# Altium project 60ghz radar main v1.1.PrjPcb (part 2 of 2)

## Sheet radar sch.SchDoc
size A4; SheetNumber: 3; SheetTotal: 4
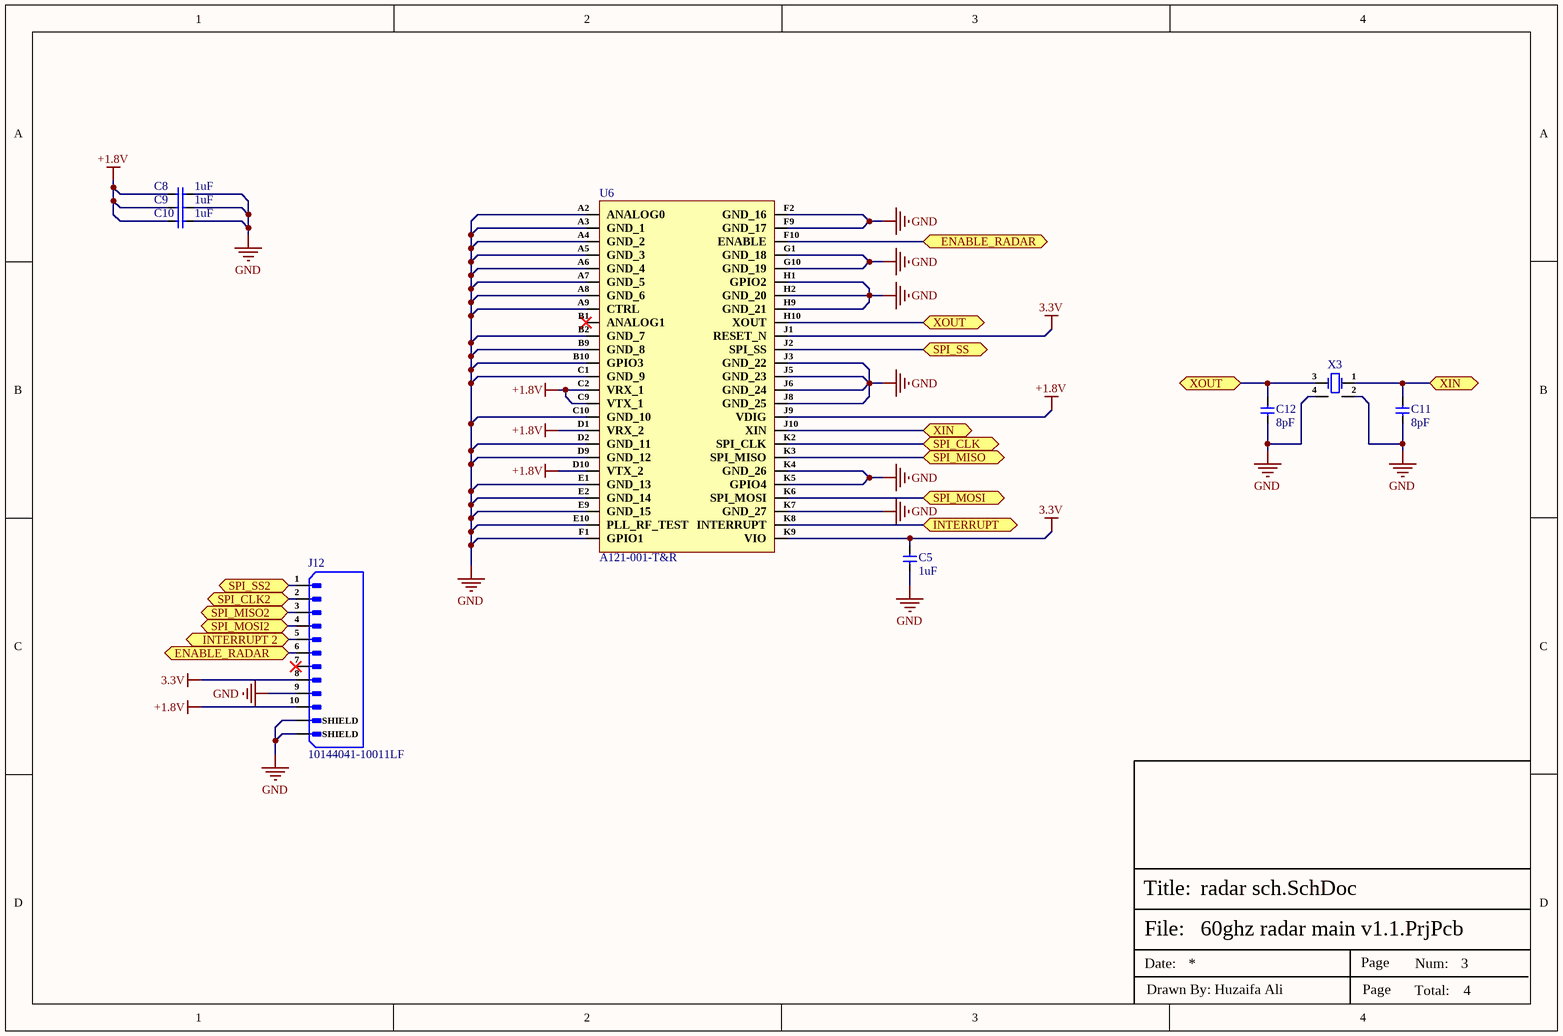
[diagram p2: radar sch.SchDoc]

### Parts
C5  1uF  [Cap-0402]
C8  1uF  [Cap-0402]
C9  1uF  [Cap-0402]
C10  1uF  [Cap-0402]
C11  8pF  [Cap-0402]
C12  8pF  [Cap-0402]
J12  10144041-10011LF  [10144041-10011LF]
U6  A121-001-T&R  [50-FCCSP (5.2x5.5)]
X3  ECS-240-8-36-RWN-TR3  [SMD2520-4P]  (value not drawn)

### Ports
ENABLE_RADAR (bidir), INTERRUPT 2 (bidir), INTERRUPT (bidir), SPI_CLK2 (bidir), SPI_CLK (bidir), SPI_MISO2 (bidir), SPI_MISO (bidir), SPI_MOSI2 (bidir), SPI_MOSI (bidir), SPI_SS2 (bidir), SPI_SS (bidir), XIN (bidir), XOUT (bidir)

### Nets
3.3V: C5.2 J12.8 U6.J1(RESET_N) U6.K9(VIO)
+1.8V: C8.1 C9.1 C10.1 J12.10 U6.C2(VRX_1) U6.C9(VTX_1) U6.D1(VRX_2) U6.D10(VTX_2) U6.J9(VDIG)
GND: C5.1 C8.2 C9.2 C10.2 C11.1 C12.1 J12.9 J12.S1(SHIELD) U6.A2(ANALOG0) U6.A3(GND_1) U6.A4(GND_2) U6.A5(GND_3) U6.A6(GND_4) U6.A7(GND_5) U6.A8(GND_6) U6.A9(CTRL) U6.B2(GND_7) U6.B9(GND_8) U6.B10(GPIO3) U6.C1(GND_9) U6.C10(GND_10) U6.D2(GND_11) U6.D9(GND_12) U6.E1(GND_13) U6.E2(GND_14) U6.E9(GND_15) U6.E10(PLL_RF_TEST) U6.F1(GPIO1) U6.F2(GND_16) U6.F9(GND_17) U6.G1(GND_18) U6.G10(GND_19) U6.H1(GPIO2) U6.H2(GND_20) U6.H9(GND_21) U6.J3(GND_22) U6.J5(GND_23) U6.J6(GND_24) U6.J8(GND_25) U6.K4(GND_26) U6.K5(GPIO4) U6.K7(GND_27) X3.2(GND) X3.4(GND)
ENABLE_RADAR: J12.6 U6.F10(ENABLE) ; port ENABLE_RADAR
INTERRUPT: U6.K8(INTERRUPT) ; port INTERRUPT
INTERRUPT 2: J12.5 ; port INTERRUPT 2
SPI_CLK: U6.K2(SPI_CLK) ; port SPI_CLK
SPI_CLK2: J12.2 ; port SPI_CLK2
SPI_MISO: U6.K3(SPI_MISO) ; port SPI_MISO
SPI_MISO2: J12.3 ; port SPI_MISO2
SPI_MOSI: U6.K6(SPI_MOSI) ; port SPI_MOSI
SPI_MOSI2: J12.4 ; port SPI_MOSI2
SPI_SS: U6.J2(SPI_SS) ; port SPI_SS
SPI_SS2: J12.1 ; port SPI_SS2
XIN: C11.2 U6.J10(XIN) X3.1(IN/OUT) ; port XIN
XOUT: C12.2 U6.H10(XOUT) X3.3(Out/In) ; port XOUT

Not connected (* = marked no-connect by the designer): J12 7*; U6 B1(ANALOG1)*

### Notes on the sheet
- File:
- Title:
- Date:
- Page
- Num:
- Total:
- Drawn By: Huzaifa Ali

### Library data of the parts
C5 C8-C10 = CC0402KRX5R6BB105: CAP CER 1UF 10V X5R 0402; Manufacturer: Yageo; Tolerance: 10%; Dissipation Factor: 15%; Item Type: Capacitor; Supplier 1: Mouser; Manufacturer Part Number: CC0402KRX5R6BB105; RoHS: Yes; Category: Ceramic Capacitors; Stock 1: 6711367; Pricing 1: 1=0.11000, 10=0.05500, 50=0.05500, 100=0.03300, 500=0.02700, 1000=0.02200, 2500=0.02100, 10000=0.01800 (USD); Mount: Surface Mount; Case/Package: 0402; Number of Pins: 2; Case Code (Metric): 1005; Case Code (Imperial): 0402; Min Operating Temperature: -55°C; Max Operating Temperature: 85°C; Capacitance: 1uF; Dielectric: X5R; Package Quantity: 1; Voltage Rating: 10V; Packaging: Tape and Reel; Voltage Rating (DC): 10V; Termination: SMD/SMT; Resistor Type: Ceramic; Series: CC; Construction: Flat; Length: 1mm; Width: 0.02inch; Height: 0.5mm; Thickness: 0.022inch; Depth: 0.5mm; Radiation Hardening: No; REACH SVHC: No SVHC; Lead Free: Lead Free; Halogen Free: Halogen Free; RoHS Compliant: Yes; ComponentLink1URL: https://datasheet.ciiva.com/176/upy-gphc-x5r-4v-to-50v-12-176704.pdf?src-supplier=Digi-Key; ComponentLink1Description: https://datasheet.ciiva.com/176/upy-gphc-x5r-4v-to-50v-12-176704.pdf?src-supplier=Digi-Key; ComponentLink2URL: https://datasheet.ciiva.com/176/mlccorderingcode-176705.pdf?src-supplier=Digi-Key; ComponentLink2Description: https://datasheet.ciiva.com/176/mlccorderingcode-176705.pdf?src-supplier=Digi-Key; ComponentLink3URL: https://datasheet.ciiva.com/176/mlccorderingcode-176706.pdf?src-supplier=Digi-Key; ComponentLink3Description: https://datasheet.ciiva.com/176/mlccorderingcode-176706.pdf?src-supplier=Digi-Key; Supplier Part Number 1: 603-CC402KRX5R6BB105; LCSC Part Number: C106254
C11 C12 = 0402CG8R0C500NT: 50V 8pF C0G 0402 Multilayer Ceramic Capacitors MLCC - SMD/SMT ROHS; Manufacturer: FH (Guangdong Fenghua Advanced Tech); Manufacturer Part Number: 0402CG8R0C500NT; Package: 0402; LCSC Part Number: C1578; Item Type: Capacitor; ComponentLink1Description: LCSC; ComponentLink1URL: https://www.lcsc.com/product-detail/Multilayer-Ceramic-Capacitors-MLCC-SMD-SMT_FH-Guangdong-Fenghua-Advanced-Tech-0402CG8R0C500NT_C1578.html
J12 = 10144041-10011LF: CONN HEADER SMD R/A 10POS 0.8MM; Manufacturer: Amphenol ICC (FCI); Item Type: Right Angle Connector; Package: Custom; Manufacturer Part Number: 10144041-10011LF
U6 = A121-001-T&R: RADAR SENSOR SYSTEM-IN-PACKAGE B; Manufacturer: Acconeer; Item Type: IC; Supplier: Mouser; Supplier Part Number: 925-A121-001-T&R; Manufacturer Part Number: A121-001-T&R; RoHS: No; Category: LDO; Stock: 7442; Pricing: 1=13.72, 10=11.57, 50=10.22, 100=8.78, 1000=7.74, 10000=6.41 (USD)
X3 = ECS-240-8-36-RWN-TR3: CRYSTAL 24.0000MHZ 8PF SMD; Manufacturer: ECS Inc.; Package: None; Manufacturer Part Number: ECS-240-8-36-RWN-TR3; Item Type: Crystal

## Sheet battery check and motor.SchDoc
size A4; SheetNumber: 4; SheetTotal: 4
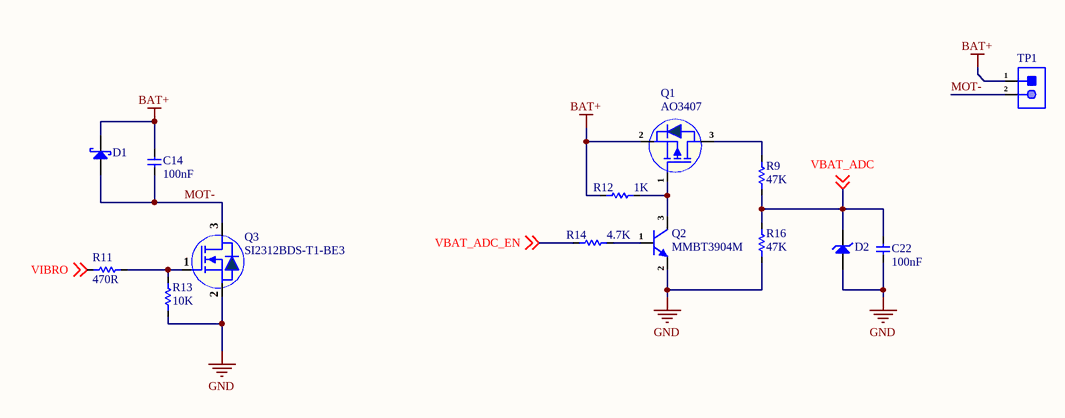
[diagram p3: battery check and motor.SchDoc]

### Parts
C14  100nF  [Cap-0402]
C22  100nF  [Cap-0402]
D1  BAT5402VH6327XTSA1  [SOD-523]  (value not drawn)
D2  MM3Z3V3B  [SOD323F]  (value not drawn)
Q1  AO3407  [SOT-23]
Q2  MMBT3904M  [SOT-723]
Q3  SI2312BDS-T1-BE3  [SOT-23]
R9  47K  [Res-0402]
R11  470R  [Res-0402]
R12  1K  [Res-0402]
R13  10K  [Res-0402]
R14  4.7K  [Res-0402]
R16  47K  [Res-0402]
TP1  2 Test Pad  [2 Test Pad]  (value not drawn)  (no BOM)

### Nets
BAT+: C14.2 D1.2(K) Q1.2(S) R12.1 TP1.1
GND: C22.2 D2.1(A) Q2.2(E) Q3.2(S) R13.1 R16.1
MOT-: C14.1 D1.1(A) Q3.3(D) TP1.2
VBAT_ADC: C22.1 D2.2(K) R9.1 R16.2 ; off-sheet VBAT_ADC
VBAT_ADC_EN: R14.1 ; off-sheet VBAT_ADC_EN
VIBRO: R11.1 ; off-sheet VIBRO
NetQ1_1: Q1.1(G) Q2.3(C) R12.2
NetQ1_3: Q1.3(D) R9.2
NetQ2_1: Q2.1(B) R14.2
NetQ3_1: Q3.1(G) R11.2 R13.2

### Notes on the sheet
- File:
- Title:
- Date:
- Page
- Num:
- Total:
- Drawn By: Huzaifa Ali

### Library data of the parts
C14 C22 = CC0402KRX5R7BB104: CAP CER 0.1UF 16V X5R 0402; Manufacturer: Yageo; Tolerance: 10%; Supplier 1: Mouser; Manufacturer Part Number: CC0402KRX5R7BB104; RoHS: Yes; Category: Ceramic Capacitors; Stock 1: 936792; Pricing 1: 1=0.10000, 10=0.02300, 50=0.02300, 100=0.01100, 1000=0.00600, 10000=0.00400 (USD); Mount: Surface Mount; Case/Package: 0402; Number of Pins: 2; Case Code (Metric): 1005; Case Code (Imperial): 0402; Min Operating Temperature: -55°C; Max Operating Temperature: 85°C; Capacitance: 100nF; Dielectric: X5R; Packaging: Tape and Reel; Voltage Rating: 16V; Package Quantity: 1; Voltage Rating (DC): 16V; Termination: SMD/SMT; Resistor Type: Ceramic; Series: CC; Construction: Flat; Length: 1mm; Width: 0.02inch; Height: 0.5mm; Thickness: 0.022inch; Depth: 0.5mm; Radiation Hardening: No; REACH SVHC: Unknown; Lead Free: Lead Free; Halogen Free: Halogen Free; RoHS Compliant: Yes; ComponentLink1URL: https://datasheet.ciiva.com/155/mlccorderingcode-155879.pdf?src-supplier=Digi-Key; ComponentLink1Description: https://datasheet.ciiva.com/155/mlccorderingcode-155879.pdf?src-supplier=Digi-Key; ComponentLink2URL: https://datasheet.ciiva.com/155/mlccorderingcode-155878.pdf?src-supplier=Digi-Key; ComponentLink2Description: https://datasheet.ciiva.com/155/mlccorderingcode-155878.pdf?src-supplier=Digi-Key; ComponentLink3URL: https://datasheet.ciiva.com/155/mlccorderingcode-155880.pdf?src-supplier=Digi-Key; ComponentLink3Description: https://datasheet.ciiva.com/155/mlccorderingcode-155880.pdf?src-supplier=Digi-Key; ComponentLink4URL: https://datasheet.ciiva.com/11464/upy-gphc-x5r-4v-to-50v-12-11464869.pdf?src-supplier=Avnet; ComponentLink4Description: https://datasheet.ciiva.com/11464/upy-gphc-x5r-4v-to-50v-12-11464869.pdf?src-supplier=Avnet; Supplier Part Number 1: 603-CC402KRX5R7BB104; LCSC Part Number: C106204
D1 = BAT5402VH6327XTSA1: DIODE SCHOTTKY 30V 200MA SC79-2; Manufacturer: Infineon; Value: 10pF; Item Type: Diode; Supplier: Mouser; Supplier Part Number: 726-BAT5402VH6327XTS; Manufacturer Part Number: BAT5402VH6327XTSA1; RoHS: Yes; Category: Rectifier Diodes; Stock: 316819; Pricing: 1=0.39, 10=0.245, 50=0.245, 100=0.122, 1000=0.103, 10000=0.071 (USD); Package Quantity: 3000NUMBER; Reverse Voltage: 30V
D2 = MM3Z3V3B: DIODE ZENER 3.3V 200MW SOD323F; Manufacturer: ON Semiconductor / Fairchild; Forward Voltage: 1V; Tolerance: 2%; Impedance: 89R; Max Reverse Leakage Current: 4.5uA; Test Current: 5mA; Element Configuration: Single; Supplier 1: Digi-Key; Manufacturer Part Number: MM3Z3V3B; Stock 1: 473644; Pricing 1: 1=0.22, 10=0.18, 100=0.0956, 500=0.06288, 1000=0.04276 (USD); Mount: Surface Mount; Number of Pins: 2; Weight: 0.0276g; Min Operating Temperature: -65°C; Max Operating Temperature: 150°C; Packaging: Tape and Reel; Package Quantity: 1; Max Power Dissipation: 200mW; Zener Voltage: 3.3V; Voltage Tolerance: 2%; Power Dissipation: 200mW; Working Voltage: 3.3V; Peak Reverse Current: 4.5uA; Length: 1.3mm; Height: 1mm; Width: 1.7mm; Radiation Hardening: No; REACH SVHC: No SVHC; Lead Free: Lead Free; ComponentLink1URL: http://www.onsemi.com/pub/Collateral/MM3Z9V1B-D.pdf?src-supplier=Digi-Key; ComponentLink1Description: http://www.onsemi.com/pub/Collateral/MM3Z9V1B-D.pdf?src-supplier=Digi-Key; ComponentLink2URL: http://www.mouser.com/ds/2/149/MM3Z3V3B-187166.pdf?src-supplier=Mouser; ComponentLink2Description: http://www.mouser.com/ds/2/149/MM3Z3V3B-187166.pdf?src-supplier=Mouser; ComponentLink3URL: https://www.fairchildsemi.com/datasheets/MM/MM3Z9V1B.pdf?src-supplier=Avnet; ComponentLink3Description: https://www.fairchildsemi.com/datasheets/MM/MM3Z9V1B.pdf?src-supplier=Avnet; ComponentLink4URL: http://www.farnell.com/datasheets/1706525.pdf?src-supplier=Element14; ComponentLink4Description: http://www.farnell.com/datasheets/1706525.pdf?src-supplier=Element14; Supplier Part Number 1: MM3Z3V3BCT-ND; LCSC Part Number: C2978865; Item Type: Diode
Q1 = AO3407: 30V 4.1A 60mΩ@10V,4.1A 350mW 3V@250uA P Channel SOT-23 MOSFETs ROHS; Manufacturer: Guangdong Hottech; Item Type: Mosfet; Manufacturer Part Number: AO3407; Package: SOT-23; LCSC Part Number: C181093; ComponentLink1Description: LCSC; ComponentLink1URL: https://www.lcsc.com/product-detail/MOSFETs_Guangdong-Hottech-AO3407_C181093.html
Q2 = MMBT3904M: 40V 100mW 100@10mA,1V 200mA 300MHz 300mV@50mA,5mA NPN -55℃~+150℃@(Tj) SOT-723 Bipolar Transistors - BJT ROHS; Manufacturer: TECH PUBLIC; Item Type: Mosfet; ComponentLink1Description: LCSC; ComponentLink1URL: https://www.lcsc.com/product-detail/Bipolar-Transistors-BJT_TECH-PUBLIC-MMBT3904M_C2923360.html; Manufacturer Part Number: MMBT3904M; Package: SOT-723; LCSC Part Number: C2923360
Q3 = SI2312BDS-T1-BE3: N-CHANNEL 20-V (D-S) MOSFET; Manufacturer: Vishay; Supplier: Mouser; Supplier Part Number: 78-SI2312BDS-T1-BE3; Manufacturer Part Number: SI2312BDS-T1-BE3; RoHS: Yes; Category: LDO; Stock: 345886; Pricing: 1=0.58, 10=0.493, 50=0.493, 100=0.368, 1000=0.231, 10000=0.192 (USD); Item Type: Mosfet
R9 R16 = RC0402FR-0747KL: RES 47K OHM 1% 1/16W 0402; Manufacturer: Yageo; Power Rating: 62.5mW; Temperature Coefficient: 100ppm/°C; Voltage Rating: 50V; Resistance: 47kR; Max Power Dissipation: 63mW; Item Type: Resistor; Supplier 1: Avnet; Manufacturer Part Number: RC0402FR-0747KL; RoHS: Yes; Category: Chip SMD Resistors; Stock 1: 680000; Pricing 1: 10000=0.00085, 20000=0.00087, 40000=0.00084, 60000=0.00083, 80000=0.00079, 100000=0.00078, 1000000=0.00076 (USD); Case/Package: 0402; Case Code (Imperial): 0402; Case Code (Metric): 1005; Size Code: 0402; Min Operating Temperature: -55°C; Max Operating Temperature: 155°C; Tolerance: 1%; Series: RC; Packaging: Tape and Reel; Package Quantity: 1; Termination: SMD/SMT; Resistor Type: Thick Film; Number of Terminations: 2; Features: Moisture Resistant; Resistance Tolerance: 1%; Construction: Rectangular; Length: 1mm; Width: 0.02inch; Height: 0.016inch; Depth: 0.5mm; RoHS Compliant: Yes; Military Standard: Not; Lead Free: Lead Free; ComponentLink1URL: https://datasheet.ciiva.com/46412/1018594-46412839.pdf?src-supplier=Element14; ComponentLink1Description: https://datasheet.ciiva.com/46412/1018594-46412839.pdf?src-supplier=Element14; ComponentLink2URL: https://datasheet.ciiva.com/2453/pyu-r-int-thick-7-2453389.pdf?src-supplier=Digi-Key; ComponentLink2Description: https://datasheet.ciiva.com/2453/pyu-r-int-thick-7-2453389.pdf?src-supplier=Digi-Key; ComponentLink3URL: https://datasheet.ciiva.com/2453/pyu-r-int-thick-7-2453390.pdf?src-supplier=Digi-Key; ComponentLink3Description: https://datasheet.ciiva.com/2453/pyu-r-int-thick-7-2453390.pdf?src-supplier=Digi-Key; ComponentLink4URL: https://datasheet.ciiva.com/2453/pyu-r-int-thick-7-2453388.pdf?src-supplier=Digi-Key; ComponentLink4Description: https://datasheet.ciiva.com/2453/pyu-r-int-thick-7-2453388.pdf?src-supplier=Digi-Key; ComponentLink5URL: https://datasheet.ciiva.com/15189/getdatasheetpartid-323748-15189466.pdf?src-supplier=Verical; ComponentLink5Description: https://datasheet.ciiva.com/15189/getdatasheetpartid-323748-15189466.pdf?src-supplier=Verical; ComponentLink6URL: https://datasheet.ciiva.com/16793/pyu-rc0402-51-rohs-l-6-r-16793430.pdf?src-supplier=Future+Electronics; ComponentLink6Description: https://datasheet.ciiva.com/16793/pyu-rc0402-51-rohs-l-6-r-16793430.pdf?src-supplier=Future+Electronics; Supplier Part Number 1: RC0402FR-0747KL; LCSC Part Number: C93943
R11 = 0402WGF4700TCE: 62.5mW Thick Film Resistors ±100ppm/℃ ±1% 470Ω 0402 Chip Resistor - Surface Mount ROHS; Manufacturer: UNI-ROYAL; Manufacturer Part Number: 0402WGF4700TCE; Package: 0402; LCSC Part Number: C25117; Item Type: Resistor; ComponentLink1Description: LCSC; ComponentLink1URL: https://www.lcsc.com/product-detail/Chip-span-style-background-color-ff0-Resistor-span-Surface-Mount_UNI-ROYAL-Uniroyal-Elec-0402WGF4700TCE_C25117.html
R12 = RC0402JR-071KL: RES 1K OHM 5% 1/16W 0402; Manufacturer: Yageo; Resistance: 1kR; Power Rating: 62.5mW; Voltage Rating: 50V; Temperature Coefficient: 100ppm/°C; Max Power Dissipation: 63mW; Item Type: Resistor; Supplier 1: Digi-Key; Manufacturer Part Number: RC0402JR-071KL; RoHS: Yes; Category: Chip SMD Resistors; Stock 1: 452315; Pricing 1: 1=0.10000, 10=0.01300, 100=0.00540, 1000=0.00244, 2500=0.00212, 5000=0.00175 (USD); Case/Package: 0402; Case Code (Imperial): 0402; Case Code (Metric): 1005; Size Code: 0402; Min Operating Temperature: -55°C; Max Operating Temperature: 155°C; Tolerance: 5%; Packaging: Tape and Reel; Package Quantity: 1; Termination: SMD/SMT; Resistor Type: Thick Film; Number of Terminations: 2; Features: Moisture Resistant; Series: RC; Resistance Tolerance: 5%; Construction: Rectangular; Length: 0.039inch; Width: 0.02inch; Height: 0.016inch; Depth: 0.5mm; REACH SVHC: No SVHC; Military Standard: Not; Lead Free: Lead Free; RoHS Compliant: Yes; ComponentLink1URL: https://datasheet.ciiva.com/7983/1018594-7983558.pdf?src-supplier=Element14; ComponentLink1Description: https://datasheet.ciiva.com/7983/1018594-7983558.pdf?src-supplier=Element14; ComponentLink2URL: https://datasheet.ciiva.com/2452/pyu-r-int-thick-7-2452756.pdf?src-supplier=Digi-Key; ComponentLink2Description: https://datasheet.ciiva.com/2452/pyu-r-int-thick-7-2452756.pdf?src-supplier=Digi-Key; ComponentLink3URL: https://datasheet.ciiva.com/2452/pyu-r-int-thick-7-2452757.pdf?src-supplier=Digi-Key; ComponentLink3Description: https://datasheet.ciiva.com/2452/pyu-r-int-thick-7-2452757.pdf?src-supplier=Digi-Key; ComponentLink4URL: https://datasheet.ciiva.com/2452/pyu-r-int-thick-7-2452755.pdf?src-supplier=Digi-Key; ComponentLink4Description: https://datasheet.ciiva.com/2452/pyu-r-int-thick-7-2452755.pdf?src-supplier=Digi-Key; ComponentLink5URL: https://datasheet.ciiva.com/7850/1018594-7850170.pdf?src-supplier=Element14; ComponentLink5Description: https://datasheet.ciiva.com/7850/1018594-7850170.pdf?src-supplier=Element14; ComponentLink6URL: https://datasheet.ciiva.com/7850/1018594-7850171.pdf?src-supplier=Element14; ComponentLink6Description: https://datasheet.ciiva.com/7850/1018594-7850171.pdf?src-supplier=Element14; ComponentLink7URL: https://datasheet.ciiva.com/17081/pyu-rc0402-51-rohs-l-6-r-17081438.pdf?src-supplier=Future+Electronics; ComponentLink7Description: https://datasheet.ciiva.com/17081/pyu-rc0402-51-rohs-l-6-r-17081438.pdf?src-supplier=Future+Electronics; Supplier Part Number 1: 311-1.0KJRCT-ND; LCSC Part Number: C105637
R13 = RC0402FR-0710KL: RES 10K OHM 1% 1/16W 0402; Manufacturer: Yageo; Resistance: 10kR; Voltage Rating (DC): 50V; Temperature Coefficient: 100ppm/°C; Power Rating: 62.5mW; Max Power Dissipation: 63mW; Item Type: Resistor; Supplier 1: Mouser; Manufacturer Part Number: RC0402FR-0710KL; RoHS: Yes; Category: Chip SMD Resistors; Stock 1: 18648329; Pricing 1: 1=0.10000, 10=0.01400, 50=0.01400, 100=0.00500, 1000=0.00300, 10000=0.00200 (USD); Case/Package: 0402; Number of Pins: 2; Case Code (Imperial): 0402; Case Code (Metric): 1005; Min Operating Temperature: -55°C; Max Operating Temperature: 155°C; Resistor Type: Thick Film; Tolerance: 1%; Packaging: Tape and Reel; Voltage Rating: 50V; Termination: SMD/SMT; Working Voltage: 50V; Number of Terminations: 2; Features: Moisture Resistant; Series: RC; Resistance Tolerance: 1%; Construction: Rectangular; Length: 1mm; Width: 0.5mm; Height: 0.32mm; Depth: 0.5mm; Lead Pitch: 0.2mm; REACH SVHC: No SVHC; Lead Free: Lead Free; RoHS Compliant: Yes; Military Standard: Not; ComponentLink1URL: https://datasheet.ciiva.com/7660/38568-7660787.pdf?src-supplier=Element14; ComponentLink1Description: https://datasheet.ciiva.com/7660/38568-7660787.pdf?src-supplier=Element14; ComponentLink2URL: https://datasheet.ciiva.com/7849/1686128-7849814.pdf?src-supplier=Element14; ComponentLink2Description: https://datasheet.ciiva.com/7849/1686128-7849814.pdf?src-supplier=Element14; ComponentLink3URL: https://datasheet.ciiva.com/7983/1018594-7983486.pdf?src-supplier=Element14; ComponentLink3Description: https://datasheet.ciiva.com/7983/1018594-7983486.pdf?src-supplier=Element14; ComponentLink4URL: https://datasheet.ciiva.com/22747/1018594-22747512.pdf?src-supplier=Element14; ComponentLink4Description: https://datasheet.ciiva.com/22747/1018594-22747512.pdf?src-supplier=Element14; ComponentLink5URL: https://datasheet.ciiva.com/12667/pyu-rc0402-51-rohs-l-6-r-12667067.pdf?src-supplier=Mouser; ComponentLink5Description: https://datasheet.ciiva.com/12667/pyu-rc0402-51-rohs-l-6-r-12667067.pdf?src-supplier=Mouser; ComponentLink6URL: https://datasheet.ciiva.com/7849/1784430-7849813.pdf?src-supplier=Element14; ComponentLink6Description: https://datasheet.ciiva.com/7849/1784430-7849813.pdf?src-supplier=Element14; ComponentLink7URL: https://datasheet.ciiva.com/7849/1784430-7849815.pdf?src-supplier=Element14; ComponentLink7Description: https://datasheet.ciiva.com/7849/1784430-7849815.pdf?src-supplier=Element14; Supplier Part Number 1: 603-RC0402FR-0710KL; LCSC Part Number: C60490
R14 = RC0402FR-074K7L: RES 4.7K OHM 1% 1/16W 0402; Manufacturer: Yageo; Voltage Rating (DC): 50V; Power Rating: 62.5mW; Resistance: 4.7kR; Temperature Coefficient: 100ppm/°C; Max Power Dissipation: 63mW; Item Type: Resistor; Supplier 1: Avnet; Manufacturer Part Number: RC0402FR-074K7L; RoHS: Yes; Category: Chip SMD Resistors; Stock 1: 2420000; Pricing 1: 10000=0.00085 (USD); Case/Package: 0402; Number of Pins: 2; Case Code (Imperial): 0402; Case Code (Metric): 1005; Size Code: 0402; Min Operating Temperature: -55°C; Max Operating Temperature: 155°C; Tolerance: 1%; Voltage Rating: 50V; Packaging: Tape and Reel; Resistor Type: Thick Film; Termination: SMD/SMT; Features: Moisture Resistant; Series: RC; Number of Terminations: 2; Resistance Tolerance: 1%; Construction: Rectangular; Length: 1mm; Width: 0.5mm; Height: 0.32mm; Depth: 0.5mm; Height - Seated (Max): 0.016inch; RoHS Compliant: Yes; Reach SVHC Compliant: Yes; Military Standard: Not; Lead Free: Lead Free; ComponentLink1URL: https://datasheet.ciiva.com/22661/1686128-22661342.pdf?src-supplier=Element14; ComponentLink1Description: https://datasheet.ciiva.com/22661/1686128-22661342.pdf?src-supplier=Element14; ComponentLink2URL: https://datasheet.ciiva.com/7850/1018594-7850022.pdf?src-supplier=Element14; ComponentLink2Description: https://datasheet.ciiva.com/7850/1018594-7850022.pdf?src-supplier=Element14; ComponentLink3URL: https://datasheet.ciiva.com/7850/1018594-7850023.pdf?src-supplier=Element14; ComponentLink3Description: https://datasheet.ciiva.com/7850/1018594-7850023.pdf?src-supplier=Element14; ComponentLink4URL: https://datasheet.ciiva.com/15215/getdatasheetpartid-328119-15215035.pdf?src-supplier=Verical; ComponentLink4Description: https://datasheet.ciiva.com/15215/getdatasheetpartid-328119-15215035.pdf?src-supplier=Verical; Supplier Part Number 1: RC0402FR-074K7L; LCSC Part Number: C105871
TP1 = 2 Test Pad: Wire Connecting Pad; Item Type: Test Point; Manufacturer Part Number: 2 Test Pad

## Nets that join several sheets
3.3V: main sch (13 pins), power schematic (C7.2 L2.2 R1.2 U3.4), radar sch (C5.2 J12.8 U6.J1 U6.K9)
+1.8V: power schematic (C4.2 L1.2 U2.4), radar sch (9 pins)
BAT+: power schematic (8 pins), battery check and motor (5 pins)
GND: main sch (28 pins), power schematic (14 pins), radar sch (44 pins), battery check and motor (6 pins)
VUSB: main sch (J1.A4 J1.A9 J1.B4 J1.B9), power schematic (C1.2 U1.4)
CHRG: main sch (IC2.41), power schematic (R1.1 U1.1)
EN_1.8V: main sch (IC2.10), power schematic (U2.3)
ENABLE_RADAR: main sch (IC2.21), radar sch (J12.6 U6.F10)
INTERRUPT: main sch (IC2.39), radar sch (U6.K8)
INTERRUPT 2: main sch (IC2.20), radar sch (J12.5)
SPI_CLK: main sch (IC2.15), radar sch (U6.K2)
SPI_CLK2: main sch (IC2.26), radar sch (J12.2)
SPI_MISO: main sch (IC2.16), radar sch (U6.K3)
SPI_MISO2: main sch (IC2.27), radar sch (J12.3)
SPI_MOSI: main sch (IC2.17), radar sch (U6.K6)
SPI_MOSI2: main sch (IC2.28), radar sch (J12.4)
SPI_SS: main sch (IC2.18), radar sch (U6.J2)
SPI_SS2: main sch (IC2.25), radar sch (J12.1)